# Altium schematic sheet CAN.SchDoc
size A; SheetNumber: 3; SheetTotal: 4
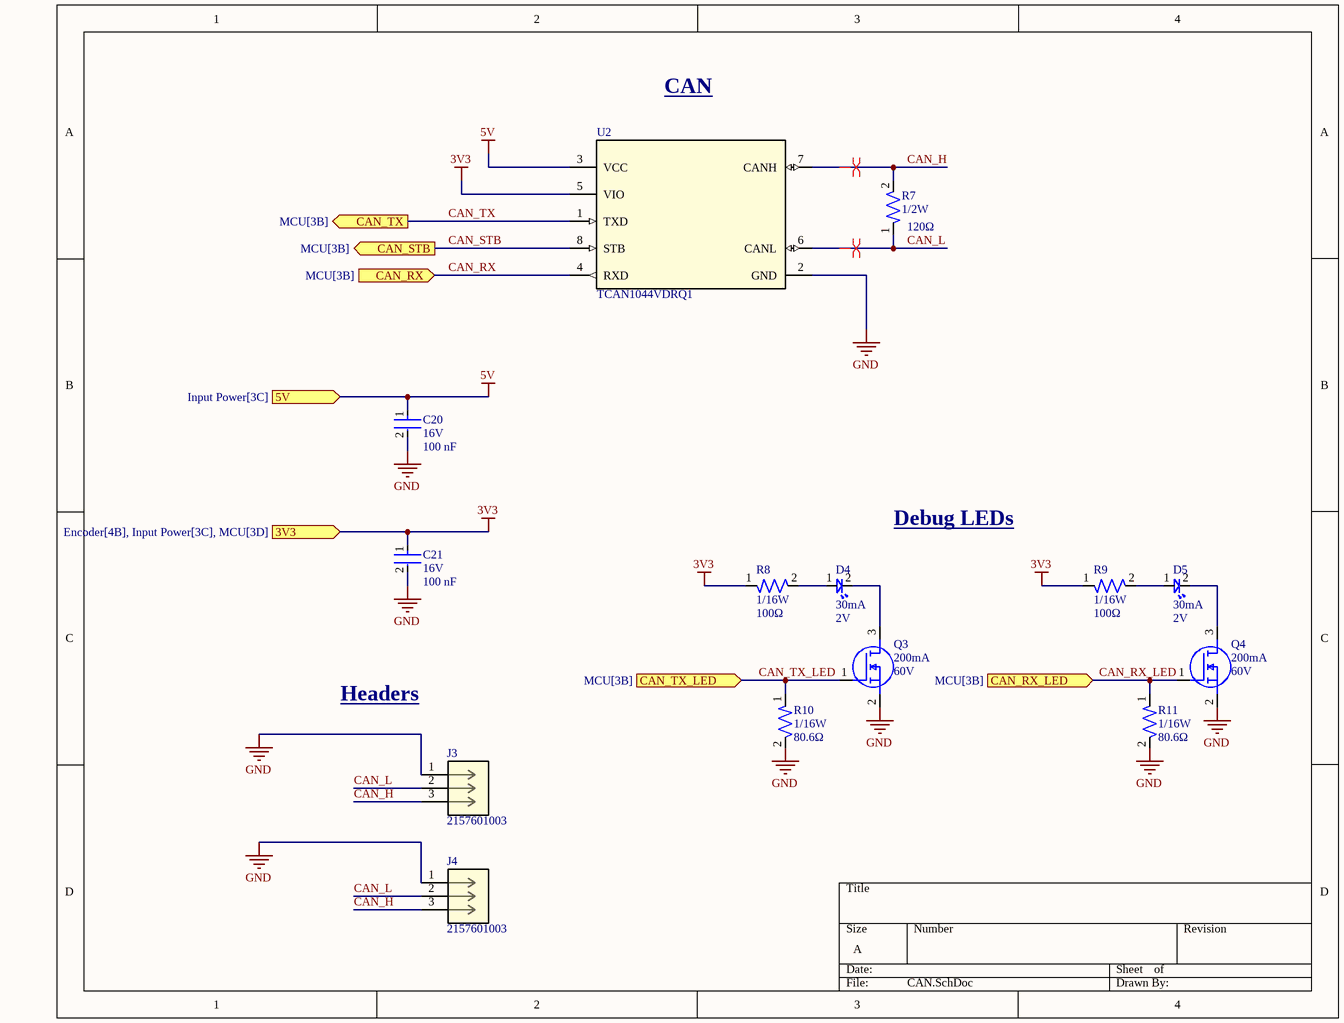
[diagram p0: CAN.SchDoc]

## Parts
C20  Voltage Rating: 16V  Capacitance: 100 nF  [CAP-0603]  (hidden comment: CAP 0603)
C21  Voltage Rating: 16V  Capacitance: 100 nF  [CAP-0603]  (hidden comment: CAP 0603)
D4  Forward Current: 30mA  Forward Voltage: 2V  [LED-0603]  (hidden comment: BL-HKC36G-AV-TRB)
D5  Forward Current: 30mA  Forward Voltage: 2V  [LED-0603]  (hidden comment: BL-HKC36G-AV-TRB)
J3  2157601003  [CONN_2157600003-SD_03_PEG_MOL]
J4  2157601003  [CONN_2157600003-SD_03_PEG_MOL]
Q3  Continuous Current: 200mA  Voltage: 60V  [IC-SOT23-3]  (hidden comment: T2N7002AK,LM)
Q4  Continuous Current: 200mA  Voltage: 60V  [IC-SOT23-3]  (hidden comment: T2N7002AK,LM)
R7  Wattage: 1/2W  Resistance: 120Ω  [RES-0603]  (hidden comment: RES 0603)
R8  Wattage: 1/16W  Resistance: 100Ω  [RES-0603]  (hidden comment: RES 0603)
R9  Wattage: 1/16W  Resistance: 100Ω  [RES-0603]  (hidden comment: RES 0603)
R10  Wattage: 1/16W  Resistance: 80.6Ω  [RES-0603]  (hidden comment: RES 0603)
R11  Wattage: 1/16W  Resistance: 80.6Ω  [RES-0603]  (hidden comment: RES 0603)
U2  TCAN1044VDRQ1  [IC-8SOIC]

## Ports
3V3 (in, see Encoder[4B], Input Power[3C], MCU[3D]), 5V (in, see Input Power[3C]), CAN_RX (in, see MCU[3B]), CAN_RX_LED (in, see MCU[3B]), CAN_STB (out, see MCU[3B]), CAN_TX (out, see MCU[3B]), CAN_TX_LED (in, see MCU[3B])

## Nets
3V3: C21.1 R8.1 R9.1 U2.5(VIO) ; port 3V3
5V: C20.1 U2.3(VCC) ; port 5V
GND: C20.2 C21.2 J3.1 J4.1 Q3.2(S) Q4.2(S) R10.2 R11.2 U2.2(GND)
CAN_H: J3.3 J4.3 R7.2 U2.7(CANH)
CAN_L: J3.2 J4.2 R7.1 U2.6(CANL)
CAN_RX: U2.4(RXD) ; port CAN_RX
CAN_RX_LED: Q4.1(G) R11.1 ; port CAN_RX_LED
CAN_STB: U2.8(STB) ; port CAN_STB
CAN_TX: U2.1(TXD) ; port CAN_TX
CAN_TX_LED: Q3.1(G) R10.1 ; port CAN_TX_LED
NetD4_1: D4.1 R8.2
NetD4_2: D4.2 Q3.3(D)
NetD5_1: D5.1 R9.2
NetD5_2: D5.2 Q4.3(D)

## Layout directives
differential pair: CAN_H, CAN_L

## Notes on the sheet
- CAN
- Debug LEDs
- Headers

## Library data of the parts
D4 D5 = LED-0001: LED YELLOW CLEAR 0603 SMD; ComponentLink1Description: Datasheet; ComponentLink1URL: https://www.americanbrightled.com/pdffiles/led-components/smt/BL-HKC36G-AV-TRB.pdf
J3 J4 = CONN MF+ 3 PIN Right Angle: Micro-Fit+ Right-Angle Header, Through Hole, 3.00mm Pitch, Single Row, 3  Circuits, Matte Tin (Sn) Plating, Glow-Wire Capable, Black; Manufacturer_Name: Molex; Copyright: Copyright (C) 2026 Ultra Librarian. All rights reserved.; Manufacturer_Part_Number: 2157601003; Datasheet: https://www.molex.com/en-us/products/part-detail-pdf/2157601003?display=pdf; RefDes: RefDes; Type: Type
Q3 Q4 = NMOS-200MA-0001: MOSFET N-CH 60V 200MA SOT23; ComponentLink1Description: Datasheet; ComponentLink1URL: https://toshiba.semicon-storage.com/info/T2N7002AK_datasheet_en_20150401.pdf?did=29712&prodName=T2N7002AK
U2 = IC-CAN-0001: IC TRANSCEIVER 1/1 8SOIC; ComponentLink1Description: Datasheet; ComponentLink1URL: https://www.ti.com/lit/ds/symlink/tcan1044-q1.pdf?HQS=dis-dk-null-digikeymode-dsf-pf-null-wwe&ts=1728758303289&ref_url=https%253A%252F%252Fwww.ti.com%252Fgeneral%252Fdocs%252Fsuppproductinfo.tsp%253FdistId%253D10%2526gotoUrl%253Dhttps%253A%252F%252Fwww.ti.com%252Flit%252Fgpn%252Ftcan1044-q1